# Altium schematic sheet IF_FILTER_AMP.SchDoc
size A; SheetNumber: 5; SheetTotal: 9
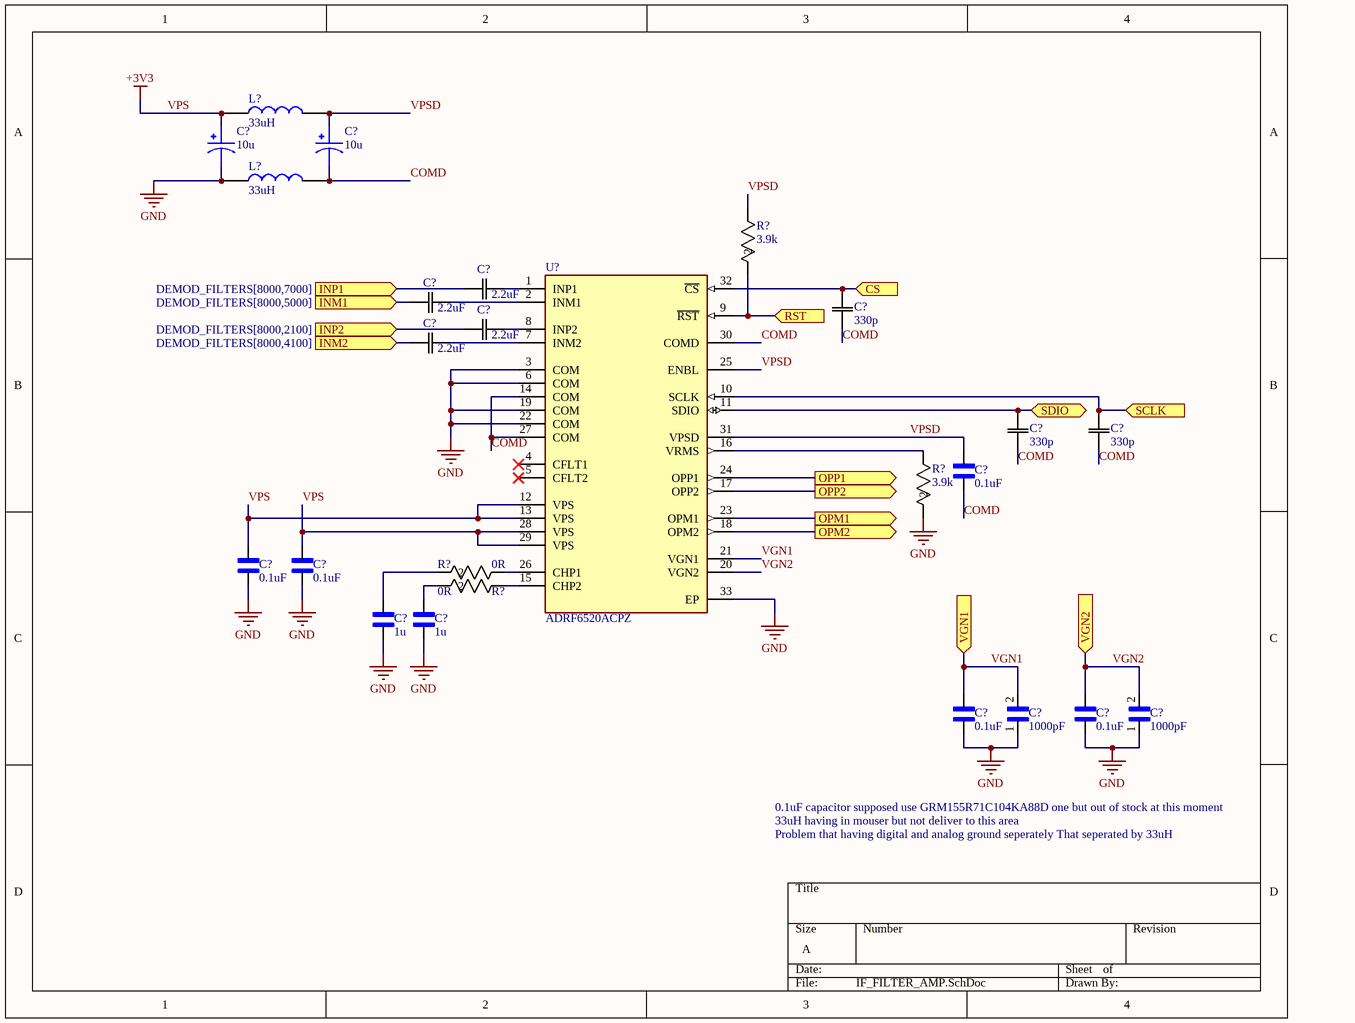
[diagram p0: IF_FILTER_AMP.SchDoc]

## Parts
(Parts that share a designator on the sheet are numbered #1, #2 ... from top to bottom, then left to right.)
C?#1  10u  [CAPPM3528X210N]
C?#2  10u  [CAPPM3528X210N]
C?#3  2.2uF  [CAP_GRM155Z_MUR]
C?#4  2.2uF  [CAP_GRM155Z_MUR]
C?#5  2.2uF  [CAP_GRM155Z_MUR]
C?#6  330p  [G-155_MUR]
C?#7  2.2uF  [CAP_GRM155Z_MUR]
C?#8  330p  [G-155_MUR]
C?#9  330p  [G-155_MUR]
C?#10  0.1uF  [CAPC1005X55N]
C?#11  0.1uF  [CAPC1005X55N]
C?#12  0.1uF  [CAPC1005X55N]
C?#13  1u  [CAPC1608X90N]
C?#14  1u  [CAPC1608X90N]
C?#15  0.1uF  [CAPC1005X55N]
C?#16  1000pF  [CAPC1005X55N]
C?#17  0.1uF  [CAPC1005X55N]
C?#18  1000pF  [CAPC1005X55N]
L?#1  33uH  [INDC5038X343N]
L?#2  33uH  [INDC5038X343N]
R?#1  3.9k  [RES0402_CRG_TYCO_TYC-M]
R?#2  3.9k  [RES0402_CRG_TYCO_TYC-M]
R?#3  0R  [RC0402N_PAN]
R?#4  0R  [RC0402N_PAN]
U?  ADRF6520ACPZ  [FP-CP-32-12-IPC_A]

## Ports
CS (in), INM1 (in, see DEMOD_FILTERS[8000,5000]), INM2 (in, see DEMOD_FILTERS[8000,4100]), INP1 (in, see DEMOD_FILTERS[8000,7000]), INP2 (in, see DEMOD_FILTERS[8000,2100]), OPM1 (out), OPM2 (out), OPP1 (out), OPP2 (out), RST (in), SCLK (in), SDIO (bidir), VGN1 (in), VGN2 (in)

## Nets
GND: C?#1.2 C?#11.1 C?#12.1 C?#13.1 C?#14.1 C?#15.1 C?#16.1 C?#17.1 C?#18.1 L?#2.1 R?#2.2 U?.3(COM) U?.6(COM) U?.19(COM) U?.22(COM) U?.33(EP)
VPS: C?#1.1 C?#11.2 C?#12.2 L?#1.1 U?.12(VPS) U?.13(VPS) U?.28(VPS) U?.29(VPS)  [also labelled +3V3]
COMD: C?#2.2 C?#6.1 C?#8.1 C?#9.1 C?#10.1 L?#2.2 U?.14(COM) U?.27(COM) U?.30(COMD)
CS: C?#6.2 U?.32(~{CS}) ; port CS
INM1: C?#4.1 ; port INM1
INM2: C?#7.1 ; port INM2
INP1: C?#3.1 ; port INP1
INP2: C?#5.1 ; port INP2
OPM1: U?.23(OPM1) ; port OPM1
OPM2: U?.18(OPM2) ; port OPM2
OPP1: U?.24(OPP1) ; port OPP1
OPP2: U?.17(OPP2) ; port OPP2
RST: R?#1.2 U?.9(~{RST}) ; port RST
SCLK: C?#9.2 U?.10(SCLK) ; port SCLK
SDIO: C?#8.2 U?.11(SDIO) ; port SDIO
VGN1: C?#15.2 C?#16.2 U?.21(VGN1) ; port VGN1
VGN2: C?#17.2 C?#18.2 U?.20(VGN2) ; port VGN2
VPSD: C?#2.1 C?#10.2 L?#1.2 R?#1.1 U?.25(ENBL) U?.31(VPSD)
NetC?#3_2: C?#3.2 U?.1(INP1)
NetC?#4_2: C?#4.2 U?.2(INM1)
NetC?#5_2: C?#5.2 U?.8(INP2)
NetC?#7_2: C?#7.2 U?.7(INM2)
NetC?#13_2: C?#13.2 R?#3.2
NetC?#14_2: C?#14.2 R?#4.2
NetR?#2_1: R?#2.1 U?.16(VRMS)
NetR?#3_1: R?#3.1 U?.26(CHP1)
NetR?#4_1: R?#4.1 U?.15(CHP2)

Not connected (* = marked no-connect by the designer): U? 4(CFLT1)* 5(CFLT2)*

## Notes on the sheet
- 0.1uF capacitor supposed use GRM155R71C104KA88D one but out of stock at this moment
- 33uH having in mouser but not deliver to this area
- Problem that having digital and analog ground seperately That seperated by 33uH

## Library data of the parts
C?#1 C?#2 = TAJB106K016RNJ-10u: Cap Tant Solid 10uF 16V B CASE 10% (3.5 X 2.8 X 1.9mm) Inward L SMD 3528-21 2.8 Ohm 125Â°C T/R; MF: KYOCERA AVX; SnapEDA_Link: https://www.snapeda.com/parts/TAJB106K016RNJ/Kyocera/view-part/?ref=snap; Package: Package; Value: *; MP: TAJB106K016RNJ; Check_prices: https://www.snapeda.com/parts/TAJB106K016RNJ/Kyocera/view-part/?ref=eda
C?#3-C?#5 C?#7 = GRM155Z71A225KE01D-2.2u: 2.2 µF ±10% 10V Ceramic Capacitor X7R 0402 (1005 Metric); Manufacturer_Name: Murata; Copyright: Copyright (C) 2026 Ultra Librarian. All rights reserved.; Manufacturer_Part_Number: GRM155Z71A225KE01D
C?#6 C?#8 C?#9 = GRM1555C1H331JA01D-330p: Description; Manufacturer_Name: Murata; Copyright: Copyright (C) 2025 Ultra Librarian. All rights reserved.; Manufacturer_Part_Number: GRM1555C1H331JA01D
C?#10-C?#12 C?#15 C?#17 = GRM155R61A104KA01J-0.1u: 0402 0.1 uF 10 V Â±10% Tolerance X5R SMT Multilayer Ceramic Capacitor; MF: Murata Electronics; SnapEDA_Link: https://www.snapeda.com/parts/GRM155R61A104KA01J/Murata+Electronics+North+America/view-part/?ref=snap; Package: 1005-2 Murata; Value: *; MP: GRM155R61A104KA01J; Check_prices: https://www.snapeda.com/parts/GRM155R61A104KA01J/Murata+Electronics+North+America/view-part/?ref=eda
C?#13 C?#14 = GCM188R71E105KA64J-1u: 1 ÂµF Â±10% 25V Ceramic Capacitor X7R 0603 (1608 Metric); MF: Murata; SnapEDA_Link: https://www.snapeda.com/parts/GCM188R71E105KA64J/Murata/view-part/?ref=snap; Package: 1608-2 MURATA; Value: *; MP: GCM188R71E105KA64J; Check_prices: https://www.snapeda.com/parts/GCM188R71E105KA64J/Murata/view-part/?ref=eda
C?#16 C?#18 = C1005X7R1H102K050BA-1n: 1000 pF Â±10% 50V Ceramic Capacitor X7R 0402 (1005 Metric); MF: TDK; Purchase-URL: https://pricing.snapeda.com/search/part/C1005X7R1H102K050BA/?ref=eda; Package: 1005 TDK; MP: C1005X7R1H102K050BA; Digi-Key_Part_Number: 445-1256-2-ND; Value: *; Check_prices: https://www.snapeda.com/parts/C1005X7R1H102K050BA/TDK/view-part/?ref=eda; SnapEDA_Link: https://www.snapeda.com/parts/C1005X7R1H102K050BA/TDK/view-part/?ref=snap
L?#1 L?#2 = 1812CS-333XJLB-33uH: Fixed Inductors 1812CS AEC-Q200 33 uH 5 % 0.15 A; Manufacturer_Name: COILCRAFT; Geometry.Height: 3.43mm; Mouser Part Number: 994-1812CS-333XJLB; Mouser Price/Stock: https://www.mouser.com/Search/Refine.aspx?Keyword=994-1812CS-333XJLB; Manufacturer_Part_Number: 1812CS-333XJLB; Datasheet Link: https://componentsearchengine.com/Datasheets/1/1812CS-333XJLB.pdf
R?#1 R?#2 = CRG0402F3K9: CRG0402 1% 3K9; Manufacturer_Name: TE Connectivity; Copyright: Copyright (C) 2026 Ultra Librarian. All rights reserved.; Manufacturer_Part_Number: CRG0402F3K9
R?#3 R?#4 = ERJ-2GE0R00X-0R: RESISTOR; 0402; 0 OHM; 0%; JUMPER; 0.10W; THICK FILM; Manufacturer_Name: Panasonic; Copyright: Copyright (C) 2025 Ultra Librarian. All rights reserved.; Manufacturer_Part_Number: ERJ-2GE0R00X
U? = ADRF6520: IC RF AMP 1.25GHZ 32LFCSP; Noise Figure: 10.5dB; P1dB: 14dBm; Gain: 53dB; Frequency: 2GHz; Operating Supply Current: 425mA; Packaging: Tray; Number of Pins: 32; Test Frequency: 2GHz